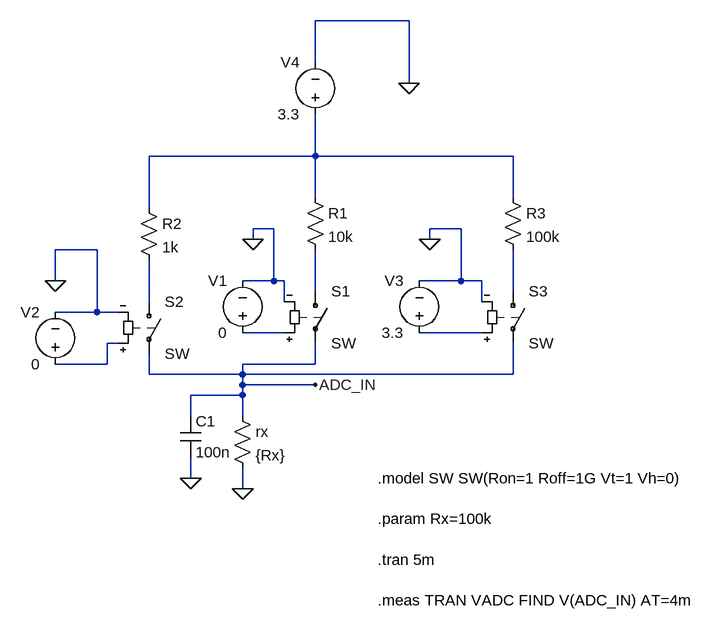
[diagram p0: schematic Resistor_Measurement_Module.asc]
Resistor_Measurement_Module.asc, the LTspice schematic file:
Version 4
SHEET 1 880 680
WIRE 256 -576 112 -576
WIRE 112 -512 112 -576
WIRE 256 -480 256 -576
WIRE 112 -368 112 -432
WIRE 112 -368 -144 -368
WIRE 416 -368 112 -368
WIRE 112 -304 112 -368
WIRE 416 -304 416 -368
WIRE -144 -288 -144 -368
WIRE 48 -256 16 -256
WIRE 336 -256 288 -256
WIRE 16 -240 16 -256
WIRE 288 -240 288 -256
WIRE -224 -224 -288 -224
WIRE -288 -176 -288 -224
WIRE 48 -176 48 -256
WIRE 48 -176 0 -176
WIRE 64 -176 48 -176
WIRE 336 -176 336 -256
WIRE 336 -176 272 -176
WIRE 368 -176 336 -176
WIRE 112 -160 112 -224
WIRE 416 -160 416 -224
WIRE -144 -144 -144 -208
WIRE 64 -144 64 -176
WIRE 368 -144 368 -176
WIRE -224 -128 -224 -224
WIRE -224 -128 -288 -128
WIRE -192 -128 -224 -128
WIRE 64 -96 0 -96
WIRE 368 -96 272 -96
WIRE -192 -80 -208 -80
WIRE -208 -48 -208 -80
WIRE -208 -48 -288 -48
WIRE 112 -48 112 -80
WIRE 112 -48 0 -48
WIRE -144 -32 -144 -64
WIRE 0 -32 0 -48
WIRE 0 -32 -144 -32
WIRE 416 -32 416 -80
WIRE 416 -32 0 -32
WIRE 0 -16 0 -32
WIRE 112 -16 0 -16
WIRE 0 0 0 -16
WIRE 0 0 -80 0
WIRE -80 32 -80 0
WIRE 0 32 0 0
WIRE -80 128 -80 96
WIRE 0 144 0 112
FLAG -80 128 0
FLAG 0 144 0
FLAG 112 -16 ADC_IN
FLAG -288 -176 0
FLAG 16 -240 0
FLAG 288 -240 0
FLAG 256 -480 0
SYMBOL cap -96 32 R0
SYMATTR InstName C1
SYMATTR Value 100n
SYMBOL res -16 16 R0
SYMATTR InstName rx
SYMATTR Value {Rx}
SYMBOL sw -144 -160 R0
SYMATTR InstName S2
SYMBOL res -160 -304 R0
SYMATTR InstName R2
SYMATTR Value 1k
SYMBOL voltage -288 -32 R180
WINDOW 0 24 96 Left 2
WINDOW 3 24 16 Left 2
WINDOW 123 0 0 Left 0
WINDOW 39 0 0 Left 0
SYMATTR InstName V2
SYMATTR Value 0
SYMBOL voltage 0 -80 R180
WINDOW 0 24 96 Left 2
WINDOW 3 24 16 Left 2
WINDOW 123 0 0 Left 0
WINDOW 39 0 0 Left 0
SYMATTR InstName V1
SYMATTR Value 0
SYMBOL sw 112 -176 R0
SYMATTR InstName S1
SYMBOL voltage 272 -80 R180
WINDOW 0 24 96 Left 2
WINDOW 3 24 16 Left 2
WINDOW 123 0 0 Left 0
WINDOW 39 0 0 Left 0
SYMATTR InstName V3
SYMATTR Value 3.3
SYMBOL sw 416 -176 R0
SYMATTR InstName S3
SYMBOL voltage 112 -416 R180
WINDOW 0 24 96 Left 2
WINDOW 3 24 16 Left 2
WINDOW 123 0 0 Left 0
WINDOW 39 0 0 Left 0
SYMATTR InstName V4
SYMATTR Value 3.3
SYMBOL res 96 -320 R0
SYMATTR InstName R1
SYMATTR Value 10k
SYMBOL res 400 -320 R0
SYMATTR InstName R3
SYMATTR Value 100k
TEXT 208 128 Left 2 !.model SW SW(Ron=1 Roff=1G Vt=1 Vh=0)\n \n.param Rx=100k\n \n.tran 5m\n \n.meas TRAN VADC FIND V(ADC_IN) AT=4m

The netlist it stands for:
* Resistor_Measurement_Module.asc
C1 ADC_IN 0 100n
rx ADC_IN 0 {Rx}
S2 N004 ADC_IN N007 0 SW
R2 N001 N004 1k
V2 N007 0 0
V1 N005 0 0
S1 N002 ADC_IN N005 0 SW
V3 N006 0 3.3
S3 N003 ADC_IN N006 0 SW
V4 N001 0 3.3
R1 N001 N002 10k
R3 N001 N003 100k
.model SW SW(Ron=1 Roff=1G Vt=1 Vh=0)
.param Rx=100k
.tran 5m
.meas TRAN VADC FIND V(ADC_IN) AT=4m
.backanno
.end

* Results of the author's LTspice run, read from the files saved beside the schematic
* From the log:
*   vadc: v(adc_in)=1.65016 at 0.004